# Altium schematic sheet control-board_E3_schematic.SchDoc: Плата
size 420 x 297 mm; Author: Советников М.; Organization: ООО "Аксима"; DocumentNumber: Э3; SheetNumber: 1; SheetTotal: 1; Title2str: управления; SheetType: Схема электрическая принципиальная
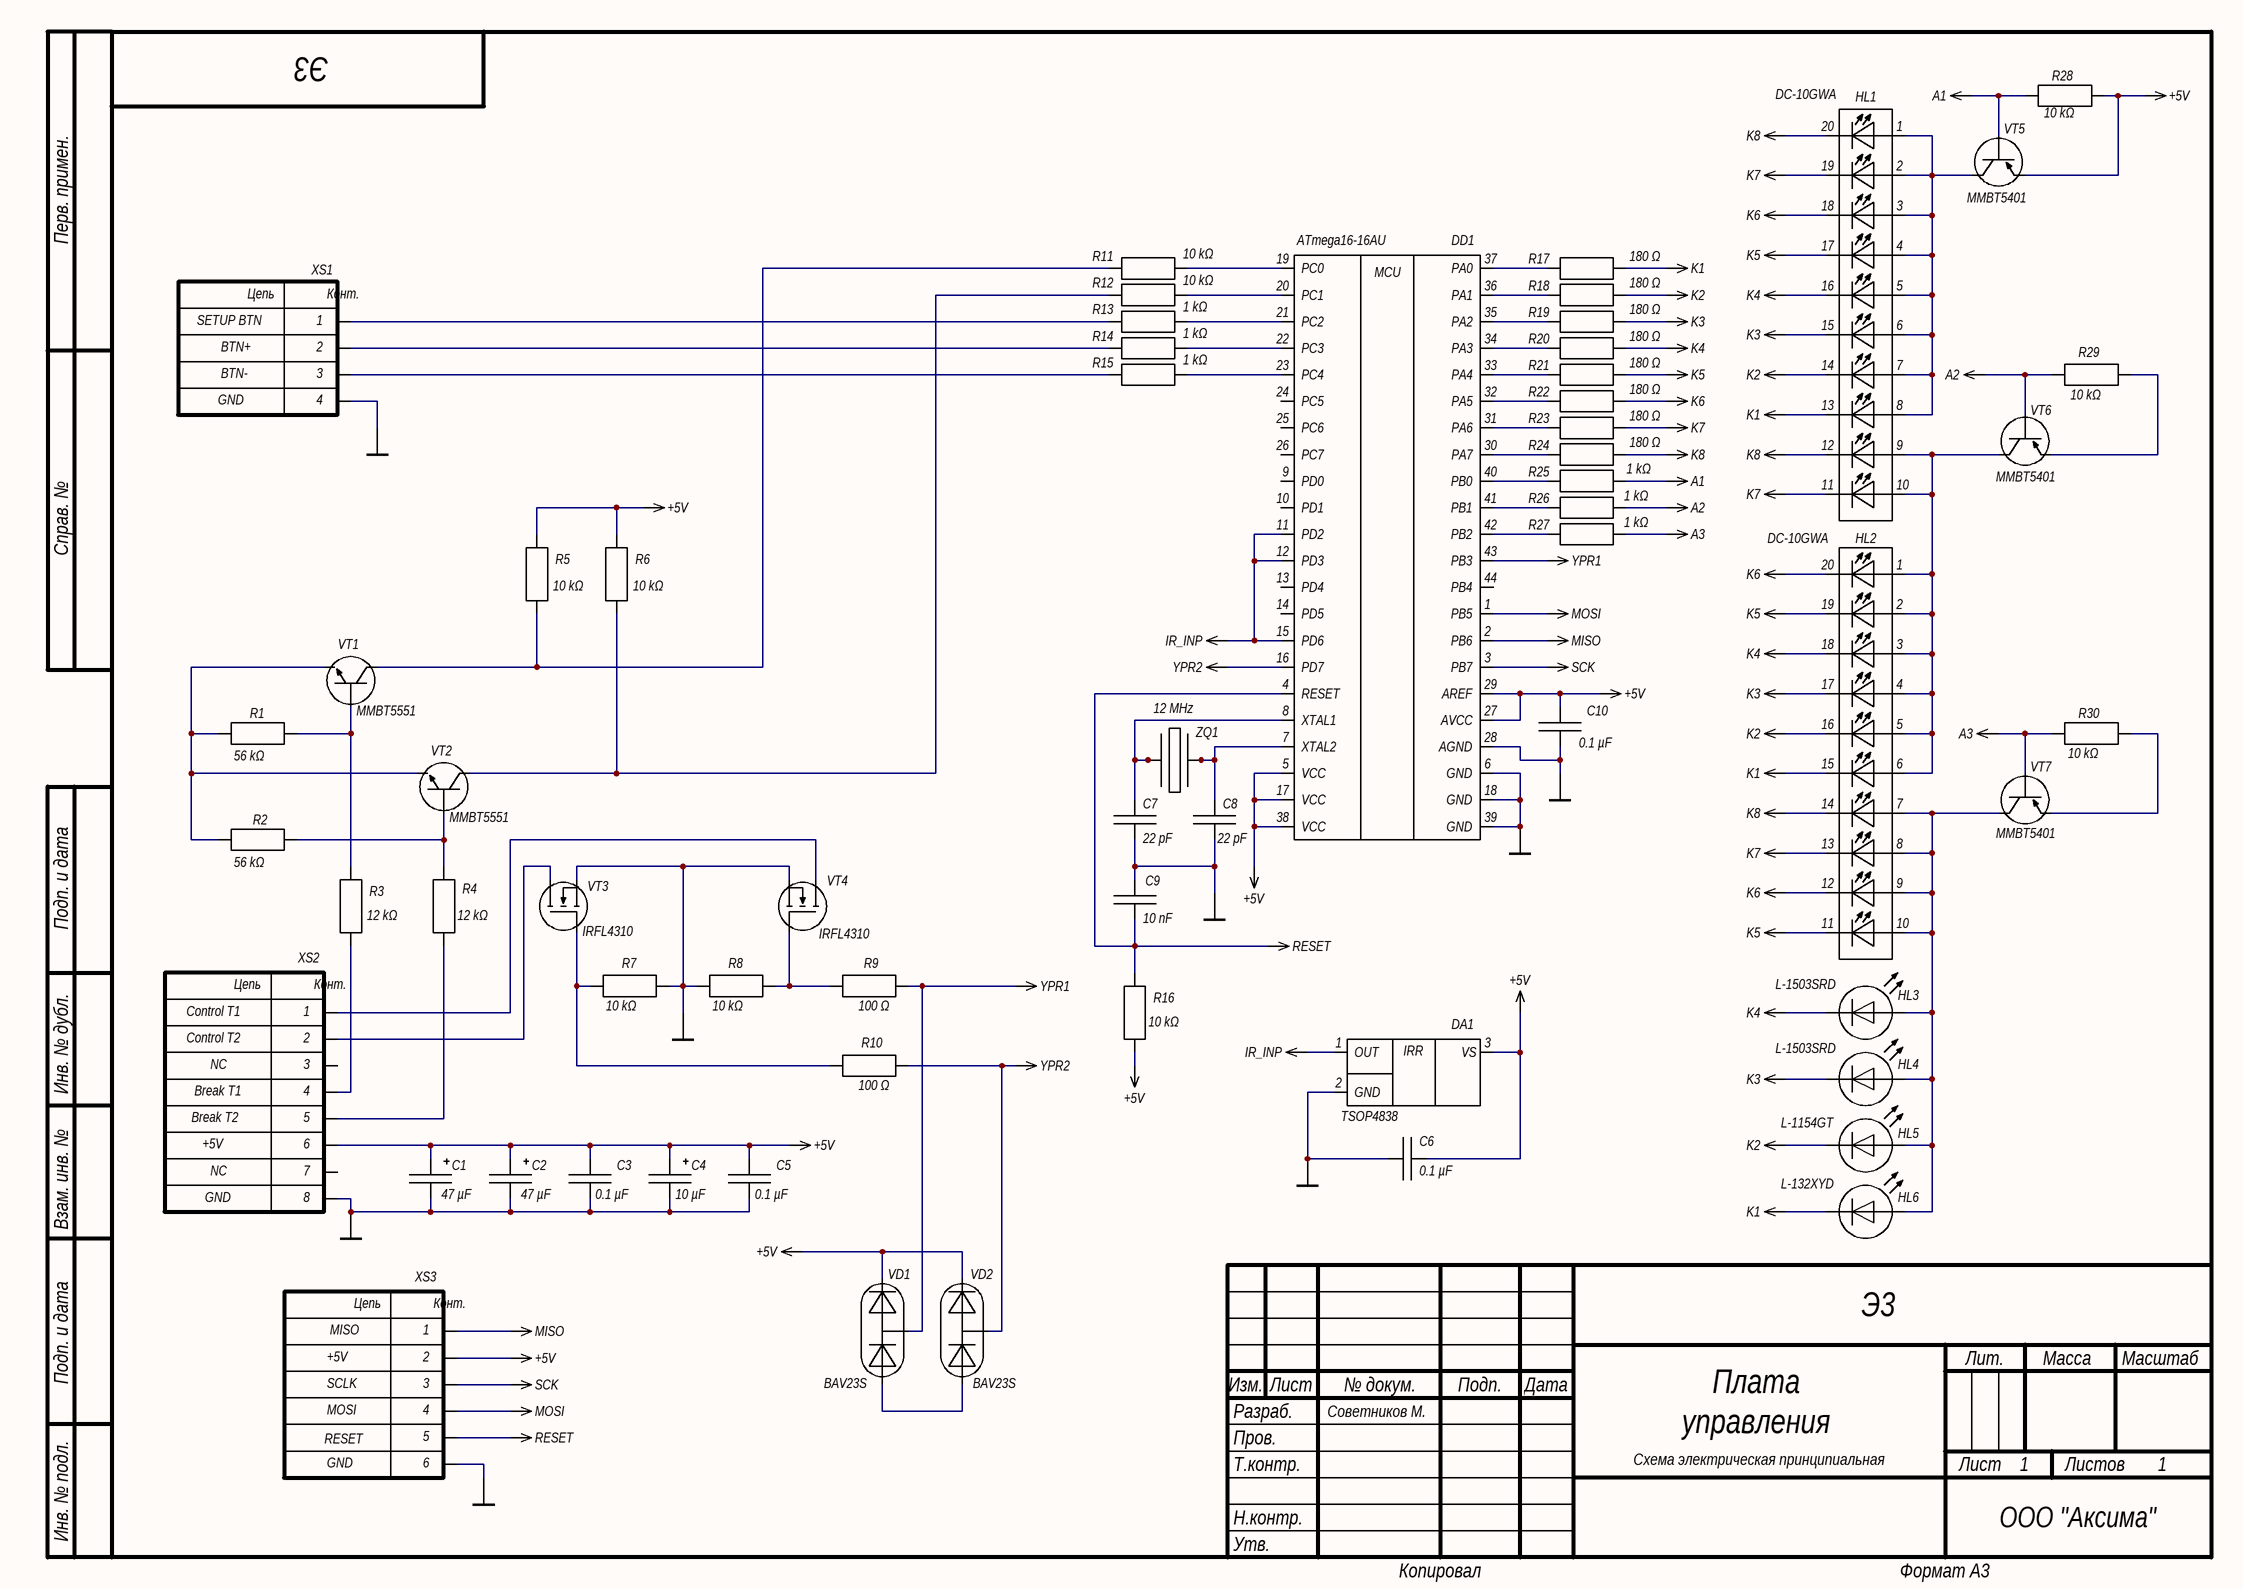
[diagram p0: control-board_E3_schematic.SchDoc]

## Parts
C1  47 µF  [C+_TCAP_SMD-B]
C2  47 µF  [C+_TCAP_SMD-B]
C3  0.1 µF  [C_1206]
C4  10 µF  [C+_TCAP_SMD-A]
C5  0.1 µF  [C_1206]
C6  0.1 µF  [C_1206]
C7  22 pF  [C_1206]
C8  22 pF  [C_1206]
C9  10 nF  [C_1206]
C10  0.1 µF  [C_1206]
DA1  TSOP4838  [DA_TSOP31238]
DD1  ATmega16-16AU  [DD_TQFP44_Atmega16]
HL1  DC-10GWA  [HL_DC-10GWA]
HL2  DC-10GWA  [HL_DC-10GWA]
HL3  L-1503SRD  [HL_LED5MM_RED]
HL4  L-1503SRD  [HL_LED5MM_RED]
HL5  L-1154GT  [HL_LED3MM_GREEN]
HL6  L-132XYD  [HL_LED3MM_YELLOW]
R1  56 kΩ  [R_1206]
R2  56 kΩ  [R_1206]
R3  12 kΩ  [R_1206]
R4  12 kΩ  [R_1206]
R5  10 kΩ  [R_1206]
R6  10 kΩ  [R_1206]
R7  10 kΩ  [R_1206]
R8  10 kΩ  [R_1206]
R9  100 Ω  [R_1206]
R10  100 Ω  [R_1206]
R11  10 kΩ  [R_1206]
R12  10 kΩ  [R_1206]
R13  1 kΩ  [R_1206]
R14  1 kΩ  [R_1206]
R15  1 kΩ  [R_1206]
R16  10 kΩ  [R_1206]
R17  180 Ω  [R_1206]
R18  180 Ω  [R_1206]
R19  180 Ω  [R_1206]
R20  180 Ω  [R_1206]
R21  180 Ω  [R_1206]
R22  180 Ω  [R_1206]
R23  180 Ω  [R_1206]
R24  180 Ω  [R_1206]
R25  1 kΩ  [R_1206]
R26  1 kΩ  [R_1206]
R27  1 kΩ  [R_1206]
R28  10 kΩ  [R_1206]
R29  10 kΩ  [R_1206]
R30  10 kΩ  [R_1206]
VD1  BAV23S  [VD_SOT-23]
VD2  BAV23S  [VD_SOT-23]
VT1  MMBT5551  [VT_sot23]
VT2  MMBT5551  [VT_sot23]
VT3  IRFL4310  [VT_SOT223]
VT4  IRFL4310  [VT_SOT223]
VT5  MMBT5401  [VT_sot23]
VT6  MMBT5401  [VT_sot23]
VT7  MMBT5401  [VT_sot23]
XS1  PLS-4R  [X_DS1022-R]  (value not drawn)
XS2  CWF-8R  [X_CWF-8R]  (value not drawn)
XS3  PLD-6  [X_PLD6]  (value not drawn)
ZQ1  12 MHz  [ZQ_HC49-S]

## Nets
+5V: C1.2 C2.2 C3.2 C4.2 C5.2 C6.1 C10.2 DA1.3(VS) DD1.5(VCC) DD1.17(VCC) DD1.27(AVCC) DD1.29(AREF) DD1.38(VCC) R5.2 R6.2 R16.1 R28.2 VD1.2 VD2.2 VT5.3(Э) XS2.6 XS3.2
A1: R25.2 R28.1 VT5.1(Б)
A2: R26.2 R29.1 VT6.1(Б)
A3: R27.2 R30.1 VT7.1(Б)
GND: C1.1 C2.1 C3.1 C4.1 C5.1 C6.2 C7.1 C8.1 C9.2 C10.1 DA1.2(GND) DD1.6(GND) DD1.18(GND) DD1.28(AGND) DD1.39(GND) R7.2 R8.1 VT3.1(И) VT4.1(И) XS1.4 XS2.8 XS3.6
IR_INP: DA1.1(OUT) DD1.11(PD2) DD1.12(PD3) DD1.15(PD6)
K1: HL1.13 HL2.15 HL6.2 R17.2
K2: HL1.14 HL2.16 HL5.2 R18.2
K3: HL1.15 HL2.17 HL4.2 R19.2
K4: HL1.16 HL2.18 HL3.2 R20.2
K5: HL1.17 HL2.11 HL2.19 R21.2
K6: HL1.18 HL2.12 HL2.20 R22.2
K7: HL1.11 HL1.19 HL2.13 R23.2
K8: HL1.12 HL1.20 HL2.14 R24.2
MISO: DD1.2(PB6) XS3.1
MOSI: DD1.1(PB5) XS3.4
RESET: C9.1 DD1.4(RESET) R16.2 XS3.5
SCK: DD1.3(PB7) XS3.3
YPR1: DD1.43(PB3) R9.2 VD1.3
YPR2: DD1.16(PD7) R10.2 VD2.3
NetC7_2: C7.2 DD1.8(XTAL1) ZQ1.1
NetC8_2: C8.2 DD1.7(XTAL2) ZQ1.2
NetDD1_19: DD1.19(PC0) R11.2
NetDD1_20: DD1.20(PC1) R12.2
NetDD1_21: DD1.21(PC2) R13.2
NetDD1_22: DD1.22(PC3) R14.2
NetDD1_23: DD1.23(PC4) R15.2
NetDD1_30: DD1.30(PA7) R24.1
NetDD1_31: DD1.31(PA6) R23.1
NetDD1_32: DD1.32(PA5) R22.1
NetDD1_33: DD1.33(PA4) R21.1
NetDD1_34: DD1.34(PA3) R20.1
NetDD1_35: DD1.35(PA2) R19.1
NetDD1_36: DD1.36(PA1) R18.1
NetDD1_37: DD1.37(PA0) R17.1
NetDD1_40: DD1.40(PB0) R25.1
NetDD1_41: DD1.41(PB1) R26.1
NetDD1_42: DD1.42(PB2) R27.1
NetHL1_1: HL1.1 HL1.2 HL1.3 HL1.4 HL1.5 HL1.6 HL1.7 HL1.8 VT5.2(К)
NetHL1_9: HL1.9 HL1.10 HL2.1 HL2.2 HL2.3 HL2.4 HL2.5 HL2.6 VT6.2(К)
NetHL2_7: HL2.7 HL2.8 HL2.9 HL2.10 HL3.1 HL4.1 HL5.1 HL6.1 VT7.2(К)
NetR1_1: R1.1 R2.1 VT1.3(Э) VT2.3(Э)
NetR1_2: R1.2 R3.2 VT1.1(Б)
NetR2_2: R2.2 R4.2 VT2.1(Б)
NetR3_1: R3.1 XS2.4
NetR4_1: R4.1 XS2.5
NetR5_1: R5.1 R11.1 VT1.2(К)
NetR6_1: R6.1 R12.1 VT2.2(К)
NetR7_1: R7.1 R10.1 VT3.2(З)
NetR8_2: R8.2 R9.1 VT4.2(З)
NetR13_1: R13.1 XS1.1
NetR14_1: R14.1 XS1.2
NetR15_1: R15.1 XS1.3
NetR29_2: R29.2 VT6.3(Э)
NetR30_2: R30.2 VT7.3(Э)
NetVD1_1: VD1.1 VD2.1
NetVT3_3: VT3.3(С) XS2.2
NetVT4_3: VT4.3(С) XS2.1

Not connected (* = marked no-connect by the designer): DD1 9(PD0) 10(PD1) 13(PD4) 14(PD5) 24(PC5) 25(PC6) 26(PC7) 44(PB4); XS2 3 7

## Notes on the sheet
- SETUP BTN
- BTN+
- BTN-
- GND
- Control Т1
- Control Т2
- NC
- Break Т2
- Break Т1
- +5V
- MISO
- SCLK
- RESET
- MOSI
- Перв. примен.
- Справ. №
- Подп. и дата
- Инв. № дубл.
- Взам. инв. №
- Разраб.
- Изм.
- Лист
- № докум.
- Подп.
- Дата
- Лит.
- Масса
- Масштаб
- Пров.
- Т.контр.
- Листов
- Инв. № подл.
- Утв.
- Н.контр.
- Копировал
- Формат А3
- (in symbol DA_IR_Receiver) IRR
- (in symbol DD_ATmega16_TQFP44) MCU
- (in symbol XP_Connector_6Pin) Цепь; Конт.
- (in symbol XS_Connector_4Pin) Цепь; Конт.
- (in symbol XS_Connector_8Pin) Цепь; Конт.

## Library data of the parts
C1 C2 C4 = C_Polarized: Tantalum capacitor, 10 V, 10%
  C1 C2: Value: 47 µF
  C4: Value: 10 µF
C3 C5 C6 C10 = C_NonPolarized: Ceramic capacitor, 250 V, 10%; Value: 0.1 µF
C7 C8 = C_NonPolarized: Ceramic capacitor, 50 V, 5%; Value: 22 pF
C9 = C_NonPolarized: Ceramic capacitor, 50 V, 10%; Value: 10 nF
DA1 = DA_IR_Receiver: Infrared receiver, 38 kHz; Value: TSOP4838
DD1 = DD_ATmega16_TQFP44: 8-bit AVR microcontroller, 16 MHz, 16 KB Flash; Value: ATmega16-16AU
HL1 HL2 = HL_LED_Bargraph: LED bar-graph display; Value: DC-10GWA
HL3 HL4 = HL_LED: Red LED; Value: L-1503SRD
HL5 = HL_LED: Green LED; Value: L-1154GT
HL6 = HL_LED: Yellow LED; Value: L-132XYD
R1 R2 R5-R8 R11-R30 = R_Resistor: Chip resistor, 0.25 W, 1%
  R1 R2: Value: 56 kΩ
  R5-R8 R11 R12 R16 R28-R30: Value: 10 kΩ
  R13-R15 R25-R27: Value: 1 kΩ
  R17-R24: Value: 180 Ω
R3 R4 R9 R10 = R_Resistor: Chip resistor, 0.25 W, 5%
  R3 R4: Value: 12 kΩ
  R9 R10: Value: 100 Ω
VD1 VD2 = VD_Dual_Diode: Dual switching diode; Value: BAV23S
VT1 VT2 = VT_Bipolar-NPN: NPN bipolar transistor, 160 V, 0.6 A; Value: MMBT5551
VT3 VT4 = VT_MOSFET-N: N-channel MOSFET, 100 V, 5 A; Value: IRFL4310
VT5-VT7 = VT_Bipolar-PNP: PNP bipolar transistor, 150 V, 0.6 A; Value: MMBT5401
XS1 = XS_Connector_4Pin: 4-pin connector (socket); Value: PLS-4R
XS2 = XS_Connector_8Pin: 8-pin connector (socket); Value: CWF-8R
XS3 = XP_Connector_6Pin: 6-pin connector (plug); Value: PLD-6
ZQ1 = ZQ_Crystal: Quartz crystal resonator; Value: 12 MHz